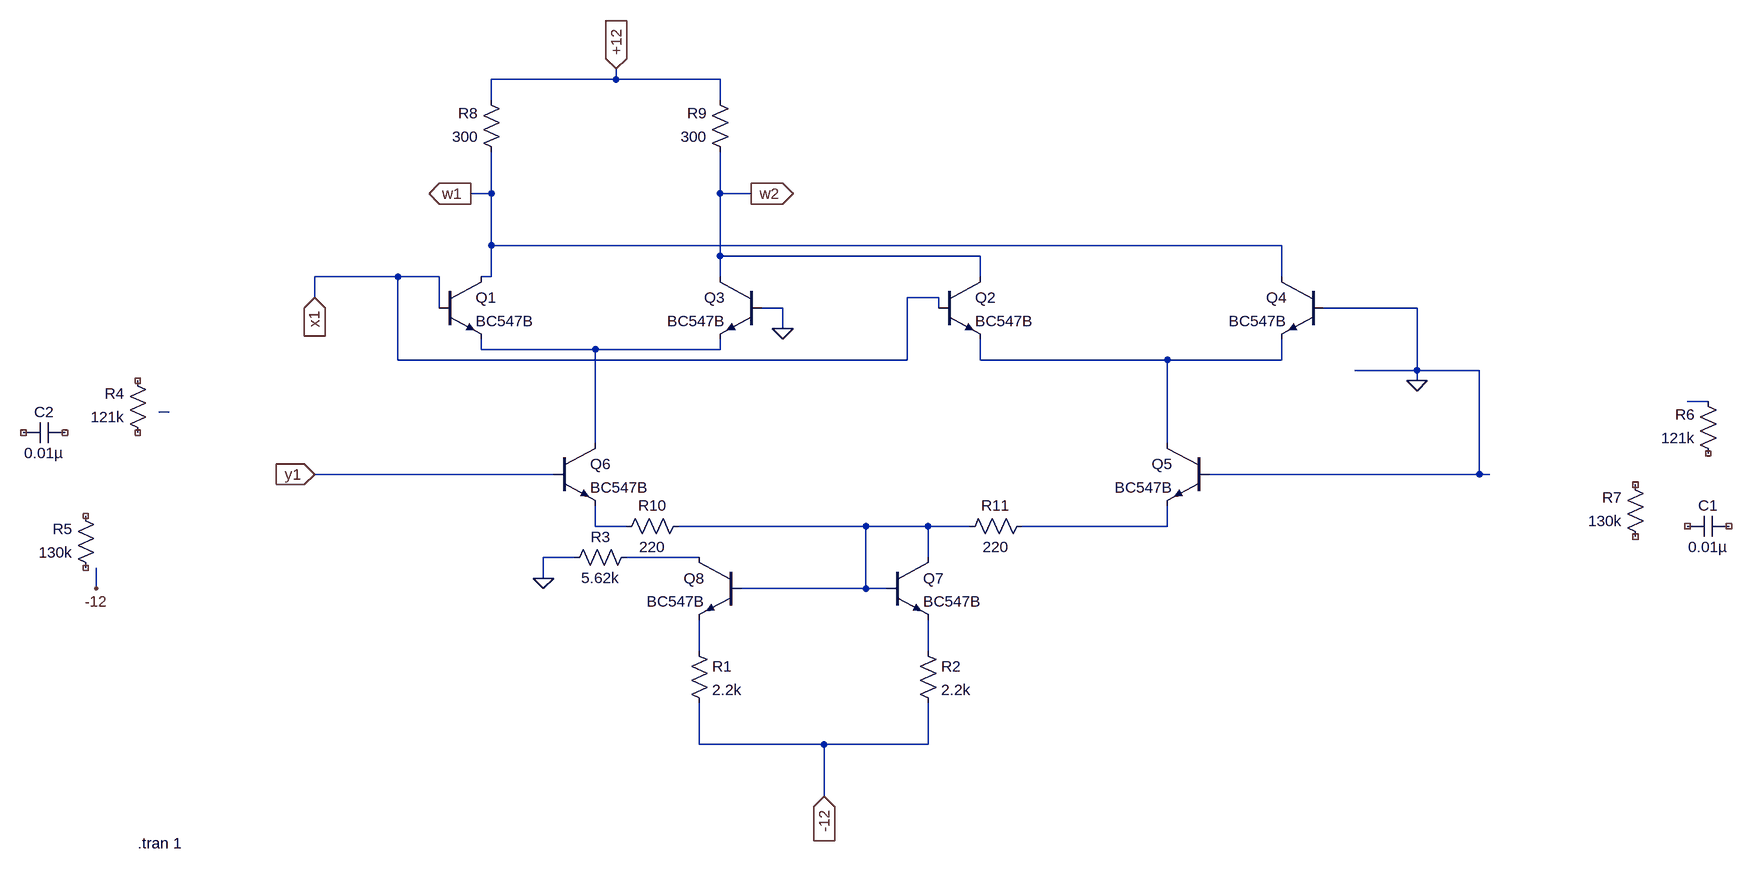
[diagram p0: schematic multipeir_3.asc]
multipeir_3.asc, the LTspice schematic file:
Version 4.1
SHEET 1 2080 996
WIRE 240 -208 240 -224
WIRE 240 -208 48 -208
WIRE 400 -208 240 -208
WIRE 48 -176 48 -208
WIRE 400 -176 400 -208
WIRE 48 -32 48 -96
WIRE 48 -32 16 -32
WIRE 400 -32 400 -96
WIRE 448 -32 400 -32
WIRE 48 48 48 -32
WIRE 1264 48 48 48
WIRE 400 64 400 -32
WIRE 800 64 400 64
WIRE -96 96 -224 96
WIRE -32 96 -96 96
WIRE 48 96 48 48
WIRE 48 96 32 96
WIRE 400 96 400 64
WIRE 800 96 800 64
WIRE 1264 96 1264 48
WIRE -224 128 -224 96
WIRE 736 128 688 128
WIRE -32 144 -32 96
WIRE 496 144 464 144
WIRE 736 144 736 128
WIRE 1472 144 1328 144
WIRE 496 176 496 144
WIRE 32 208 32 192
WIRE 208 208 32 208
WIRE 400 208 400 192
WIRE 400 208 208 208
WIRE -96 224 -96 96
WIRE 688 224 688 128
WIRE 688 224 -96 224
WIRE 800 224 800 192
WIRE 1088 224 800 224
WIRE 1264 224 1264 192
WIRE 1264 224 1088 224
WIRE 1472 240 1472 144
WIRE 1472 240 1376 240
WIRE 1568 240 1472 240
WIRE 1472 256 1472 240
WIRE 1920 288 1888 288
WIRE -448 304 -464 304
WIRE 208 352 208 208
WIRE 1088 352 1088 224
WIRE 144 400 -224 400
WIRE 1568 400 1568 240
WIRE 1568 400 1152 400
WIRE 1584 400 1568 400
WIRE 208 480 208 448
WIRE 256 480 208 480
WIRE 624 480 336 480
WIRE 720 480 624 480
WIRE 784 480 720 480
WIRE 1088 480 1088 448
WIRE 1088 480 864 480
WIRE 176 528 128 528
WIRE 368 528 256 528
WIRE 720 528 720 480
WIRE 128 560 128 528
WIRE -560 576 -560 544
WIRE 624 576 624 480
WIRE 624 576 432 576
WIRE 656 576 624 576
WIRE 368 672 368 624
WIRE 720 672 720 624
WIRE 368 816 368 752
WIRE 560 816 368 816
WIRE 720 816 720 752
WIRE 720 816 560 816
WIRE 560 896 560 816
FLAG 1472 256 0
FLAG 128 560 0
FLAG -560 576 -12
FLAG 496 176 0
FLAG 240 -224 +12
IOPIN 240 -224 In
FLAG 560 896 -12
IOPIN 560 896 In
FLAG -224 128 x1
IOPIN -224 128 In
FLAG -224 400 y1
IOPIN -224 400 In
FLAG 16 -32 w1
IOPIN 16 -32 Out
FLAG 448 -32 w2
IOPIN 448 -32 Out
SYMBOL npn -32 96 R0
SYMATTR InstName Q1
SYMATTR Value BC547B
SYMBOL npn 736 96 R0
SYMATTR InstName Q2
SYMATTR Value BC547B
SYMBOL npn 464 96 M0
SYMATTR InstName Q3
SYMATTR Value BC547B
SYMBOL npn 1328 96 M0
SYMATTR InstName Q4
SYMATTR Value BC547B
SYMBOL npn 1152 352 M0
SYMATTR InstName Q5
SYMATTR Value BC547B
SYMBOL npn 144 352 R0
SYMATTR InstName Q6
SYMATTR Value BC547B
SYMBOL npn 656 528 R0
SYMATTR InstName Q7
SYMATTR Value BC547B
SYMBOL npn 432 528 M0
SYMATTR InstName Q8
SYMATTR Value BC547B
SYMBOL res 352 656 R0
SYMATTR InstName R1
SYMATTR Value 2.2k
SYMBOL res 704 656 R0
SYMATTR InstName R2
SYMATTR Value 2.2k
SYMBOL res 272 512 R90
WINDOW 0 0 56 VBottom 2
WINDOW 3 32 56 VTop 2
SYMATTR InstName R3
SYMATTR Value 5.62k
SYMBOL res -480 352 R180
WINDOW 0 36 76 Left 2
WINDOW 3 36 40 Left 2
SYMATTR InstName R4
SYMATTR Value 121k
SYMATTR SpiceLine tol=0 pwr=0
SYMBOL res -560 560 R180
WINDOW 0 36 76 Left 2
WINDOW 3 36 40 Left 2
SYMATTR InstName R5
SYMATTR Value 130k
SYMBOL res 1936 384 R180
WINDOW 0 36 76 Left 2
WINDOW 3 36 40 Left 2
SYMATTR InstName R6
SYMATTR Value 121k
SYMBOL res 1824 512 R180
WINDOW 0 36 76 Left 2
WINDOW 3 36 40 Left 2
SYMATTR InstName R7
SYMATTR Value 130k
SYMBOL res 64 -80 R180
WINDOW 0 36 76 Left 2
WINDOW 3 36 40 Left 2
SYMATTR InstName R8
SYMATTR Value 300
SYMBOL res 416 -80 R180
WINDOW 0 36 76 Left 2
WINDOW 3 36 40 Left 2
SYMATTR InstName R9
SYMATTR Value 300
SYMBOL cap 1952 464 R90
WINDOW 0 0 32 VBottom 2
WINDOW 3 32 32 VTop 2
SYMATTR InstName C1
SYMATTR Value 0.01µ
SYMBOL cap -608 320 R90
WINDOW 0 0 32 VBottom 2
WINDOW 3 32 32 VTop 2
SYMATTR InstName C2
SYMATTR Value 0.01µ
SYMBOL res 352 464 R90
WINDOW 0 0 56 VBottom 2
WINDOW 3 32 56 VTop 2
SYMATTR InstName R10
SYMATTR Value 220
SYMBOL res 880 464 R90
WINDOW 0 0 56 VBottom 2
WINDOW 3 32 56 VTop 2
SYMATTR InstName R11
SYMATTR Value 220
TEXT -496 968 Left 2 !.tran 1

The netlist it stands for:
* multipeir_3.asc
Q1 w1 x1 N001 0 BC547B
Q2 w2 x1 N002 0 BC547B
Q3 w2 0 N001 0 BC547B
Q4 w1 0 N002 0 BC547B
Q5 N002 0 N007 0 BC547B
Q6 N001 y1 N005 0 BC547B
Q7 N006 N006 N010 0 BC547B
Q8 N008 N006 N009 0 BC547B
R1 N009 -12 2.2k
R2 N010 -12 2.2k
R3 N008 0 5.62k
R4 NC_01 NC_02 121k tol=0 pwr=0
R5 NC_03 NC_04 130k
R6 NC_05 N003 121k
R7 NC_06 NC_07 130k
R8 w1 +12 300
R9 w2 +12 300
C1 NC_08 NC_09 0.01µ
C2 NC_10 NC_11 0.01µ
R10 N006 N005 220
R11 N007 N006 220
.model NPN NPN
.model PNP PNP
.lib standard.bjt
.tran 1
.backanno
.end